# Altium schematic sheet [02] - BLOCK DIAGRAM.SchDoc
size A2; DocumentNumber: 2; SheetNumber: 2; SheetTotal: 10
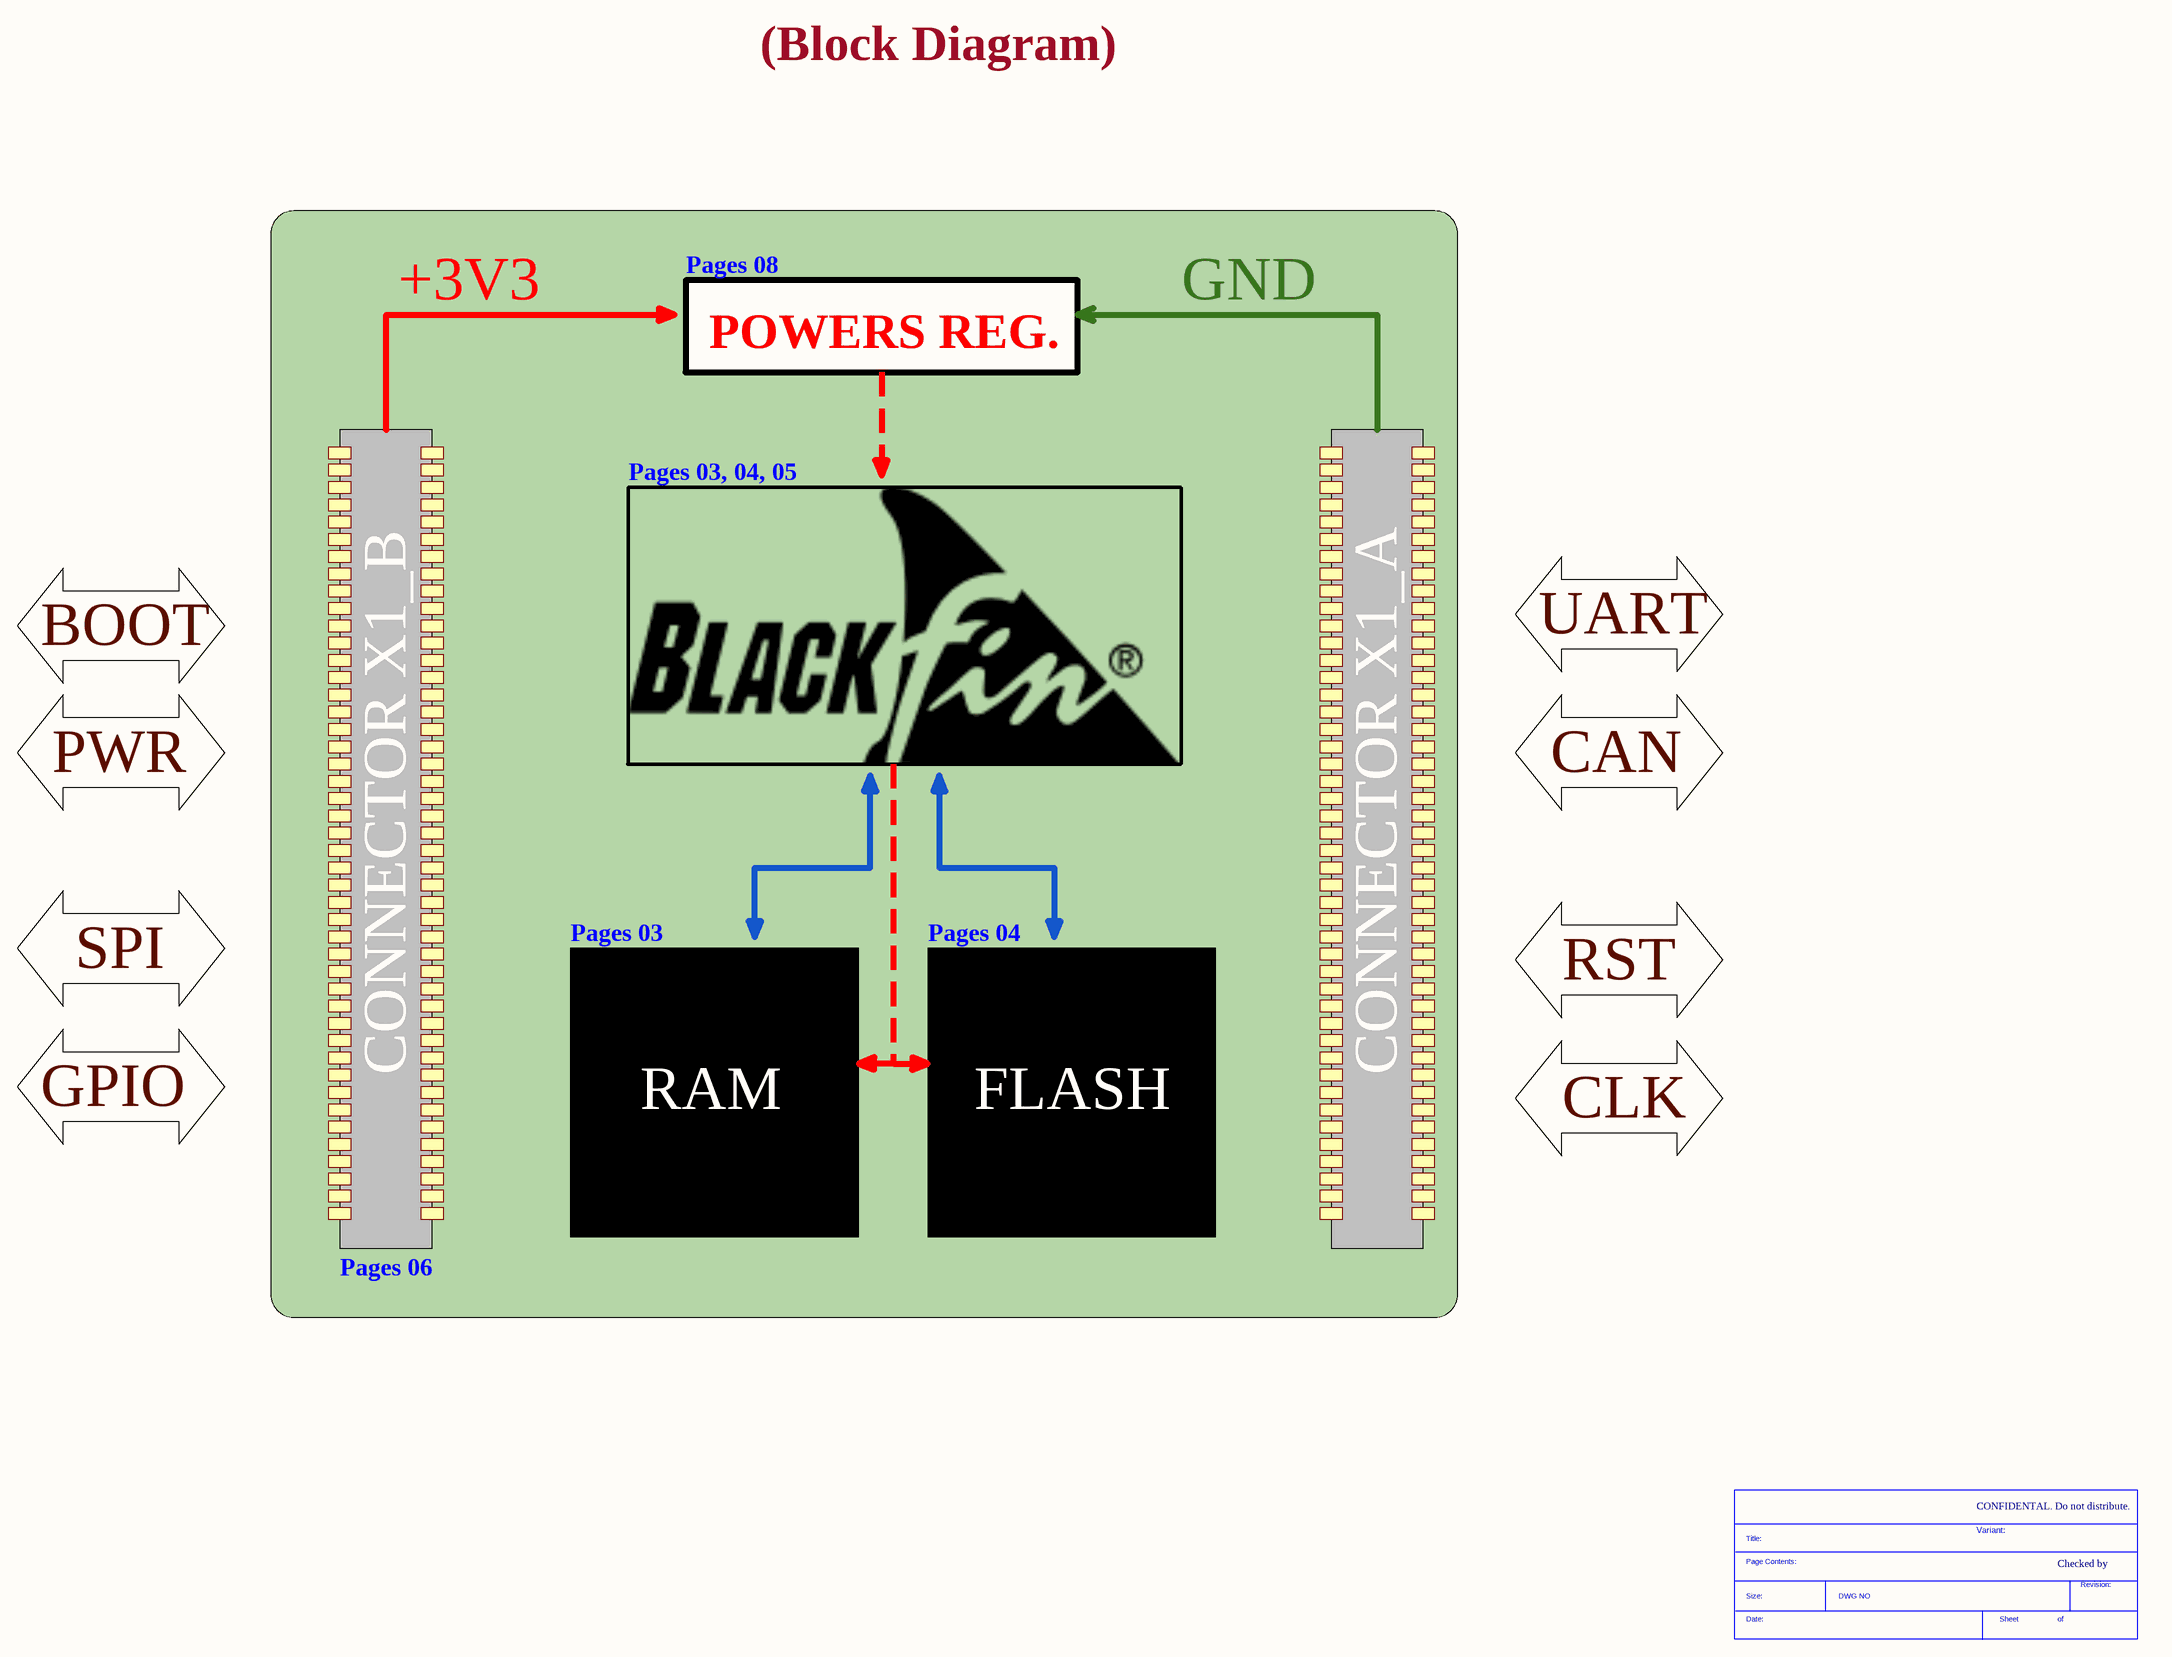
[diagram p0: [02] - BLOCK DIAGRAM.SchDoc]

## Parts
*  SDTitleBlock  (value not drawn)  (graphical)

## Notes on the sheet
- (Block Diagram)
- +3V3
- Pages 08
- GND
- POWERS REG.
- Pages 03, 04, 05
- BOOT
- UART
- PWR
- CAN
- Pages 03
- Pages 04
- SPI
- RST
- GPIO
- CONNECTOR X1_B
- CONNECTOR X1_A
- RAM
- FLASH
- CLK
- Pages 06
- CONFIDENTAL. Do not distribute.
- Variant:
- Checked by
- (in symbol SDTitleBlock) Title:; Page Contents:; Revision:; Size:; DWG NO; Date:; Sheet; of